# EAGLE design KIM1_Teletype_Board_rev1 (EAGLE 9.6.2)
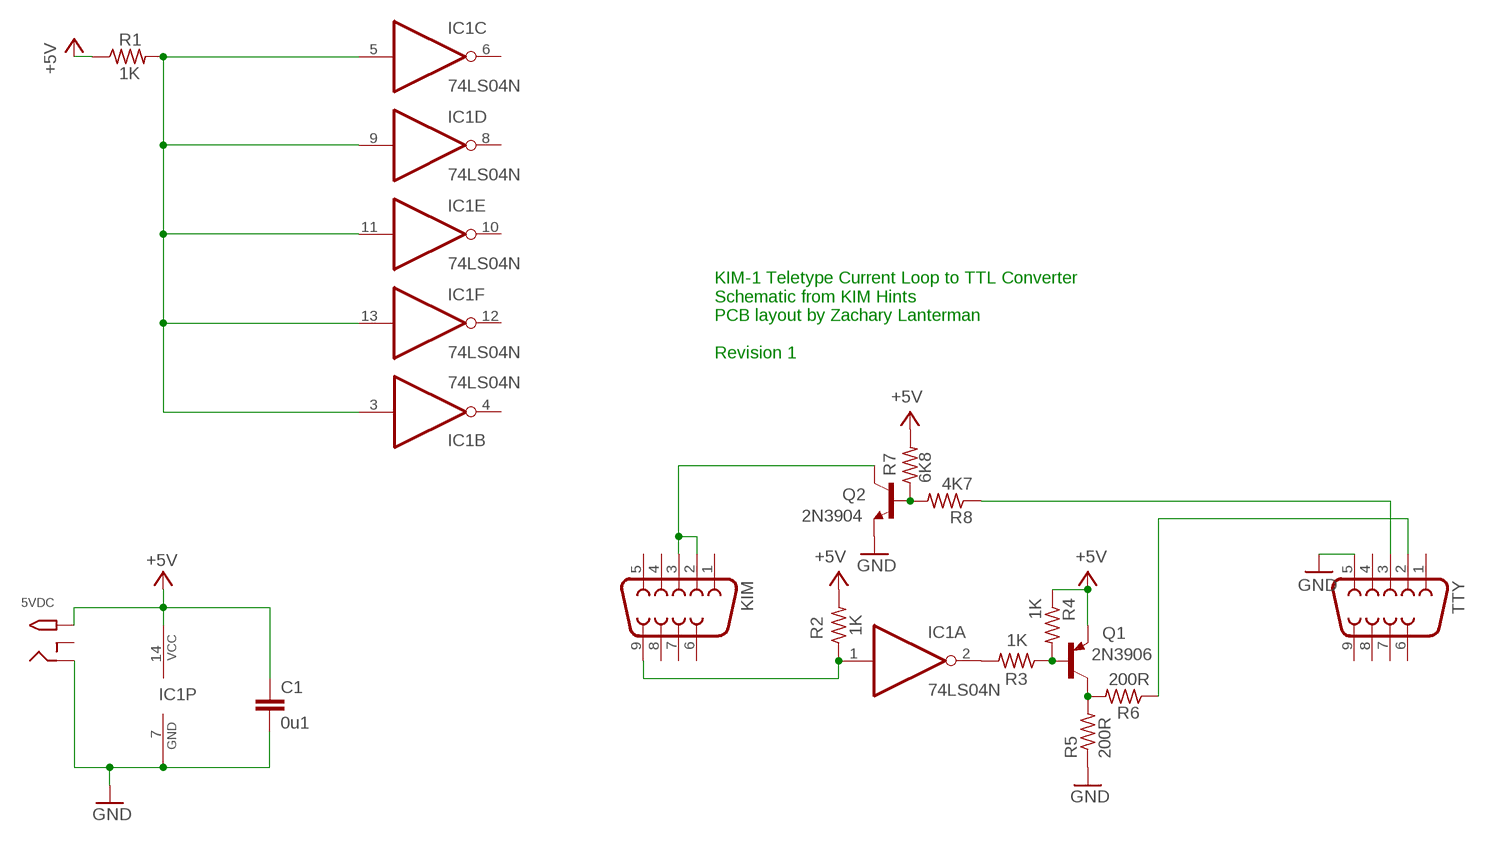
[diagram p0: schematic, sheet 1]

## Parts
5VDC  2.1MMJACKTHM  [PJ-102A]
C1  0u1  C-EU050-025X075-AARON  [C050-025X075-AARON]
IC1  74LS04N  [DIL14]
KIM  F09HP  [F09HP]
Q1  2N3906  [TO92]
Q2  2N3904  [TO92]
R1  1K  R-US_0207/10  [0207/10]
R2  1K  R-US_0207/10  [0207/10]
R3  1K  R-US_0207/10  [0207/10]
R4  1K  R-US_0207/10  [0207/10]
R5  200R  R-US_0207/10  [0207/10]
R6  200R  R-US_0207/10  [0207/10]
R7  6K8  R-US_0207/10  [0207/10]
R8  4K7  R-US_0207/10  [0207/10]
TTY  F09HP  [F09HP]

## Nets
+5V: 5VDC.TIP C1.1 IC1.14(P:VCC) Q1.3(E) R1.1 R2.2 R4.1 R7.2
GND: 5VDC.RING C1.2 IC1.7(P:GND) Q2.3(E) R5.1 TTY.5
N$1: IC1.2(A:O) R3.2
N$2: Q1.2(B) R3.1 R4.2
N$4: Q1.1(C) R5.2 R6.2
N$5: IC1.3(B:I) IC1.5(C:I) IC1.9(D:I) IC1.11(E:I) IC1.13(F:I) R1.2
N$6: R6.1 TTY.2
N$7: KIM.2 KIM.3 Q2.1(C)
N$8: Q2.2(B) R7.1 R8.2
N$9: R8.1 TTY.3
U: IC1.1(A:I) KIM.9 R2.1
Unconnected: 5VDC.RING_SW IC1.4(B:O) IC1.6(C:O) IC1.8(D:O) IC1.10(E:O) IC1.12(F:O) KIM.1 KIM.4 KIM.5 KIM.6 KIM.7 KIM.8 TTY.1 TTY.4 TTY.6 TTY.7 TTY.8 TTY.9

## Notes on the sheet
- KIM-1 Teletype Current Loop to TTL Converter
  Schematic from KIM Hints
  PCB layout by Zachary Lanterman
  
  Revision 1

## Library data of the parts
5VDC = adafruit:2.1MMJACK: 2.1mm x 5.5mm THM DC jack with internal switch. Digikey part #PJ-102A, 4UCON part #05537 2.1mm x 5.5mm SMT DC jack with internal switch. Digikey part #PJ-002A-SMT, 4UCON part #03267 By microbuilder.eu & adafruit.com
C1 = aaroncaps:C-EU: CAPACITOR, European symbol
IC1 = 74xx-us:74*04: Hex INVERTER
KIM TTY = con-subd:F09: SUB-D; OC_FARNELL: unknown; OC_NEWARK: unknown
Q1 = transistor-pnp:2N3906: PNP Transistor
Q2 = transistor:2N3904: NPN TRANSISTOR
R1-R8 = rcl:R-US_: RESISTOR, American symbol; SPICEPREFIX: R

## Board
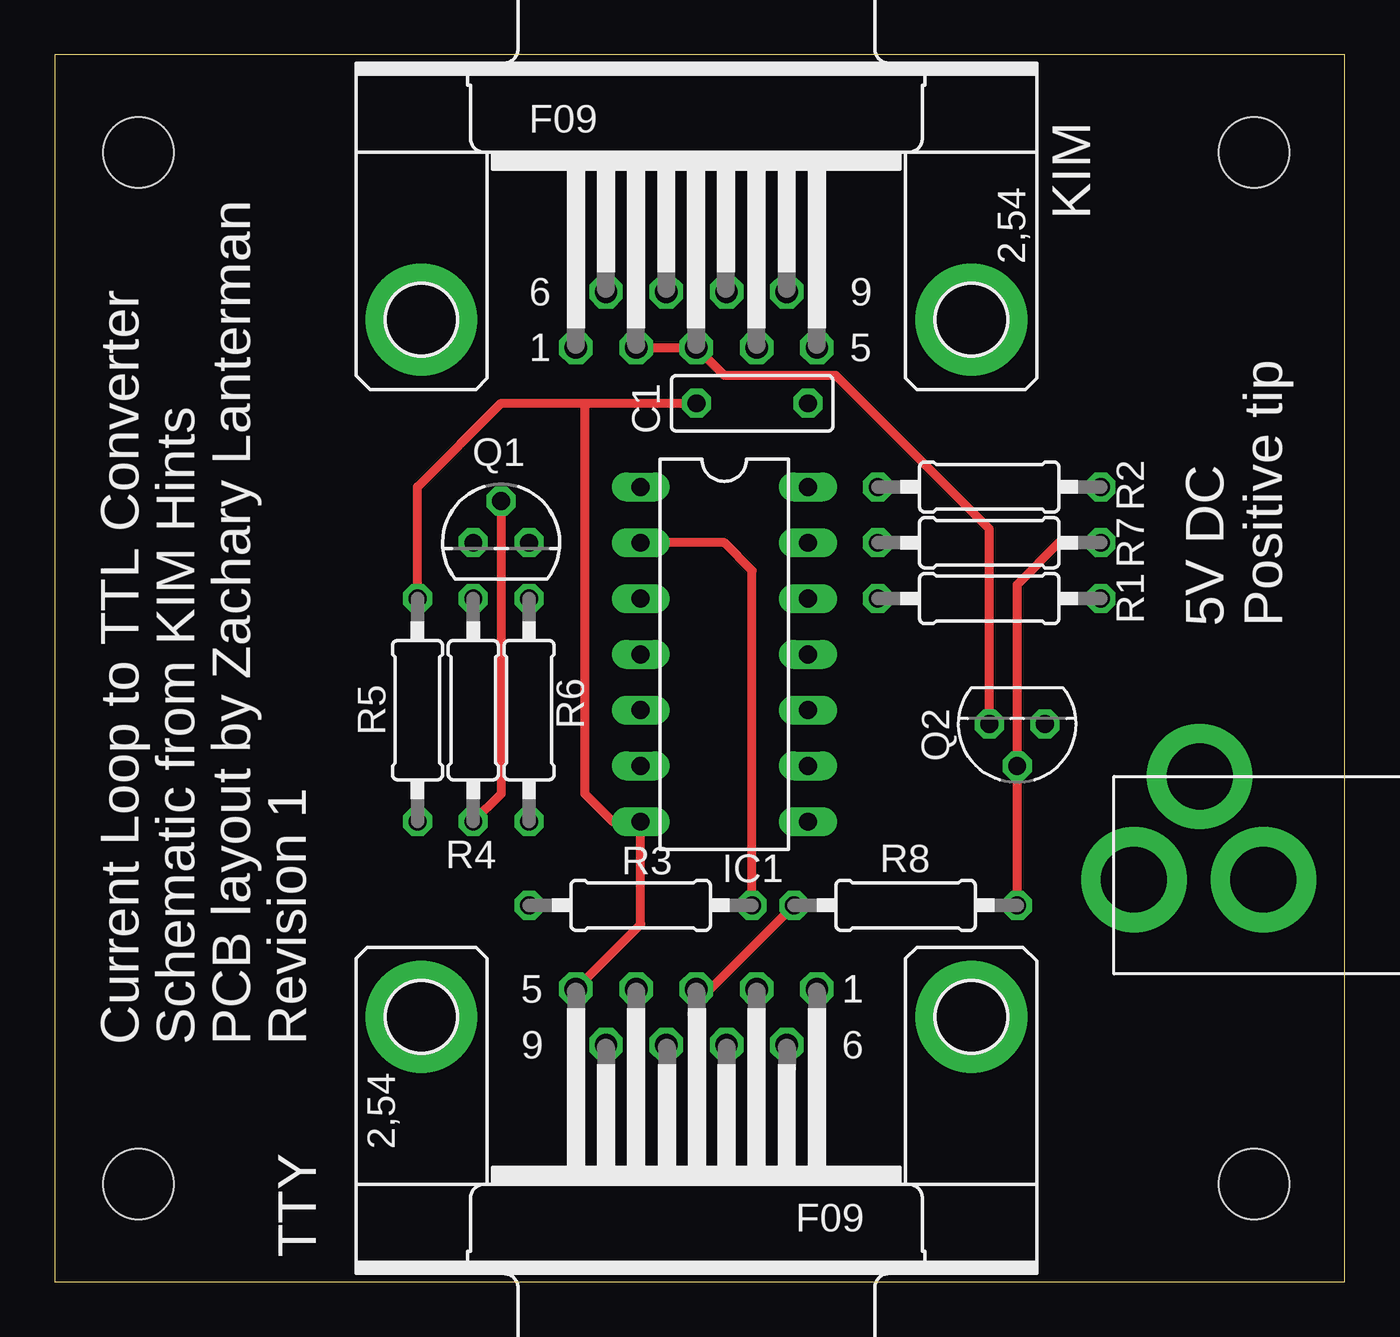
[diagram p1: board, top side]
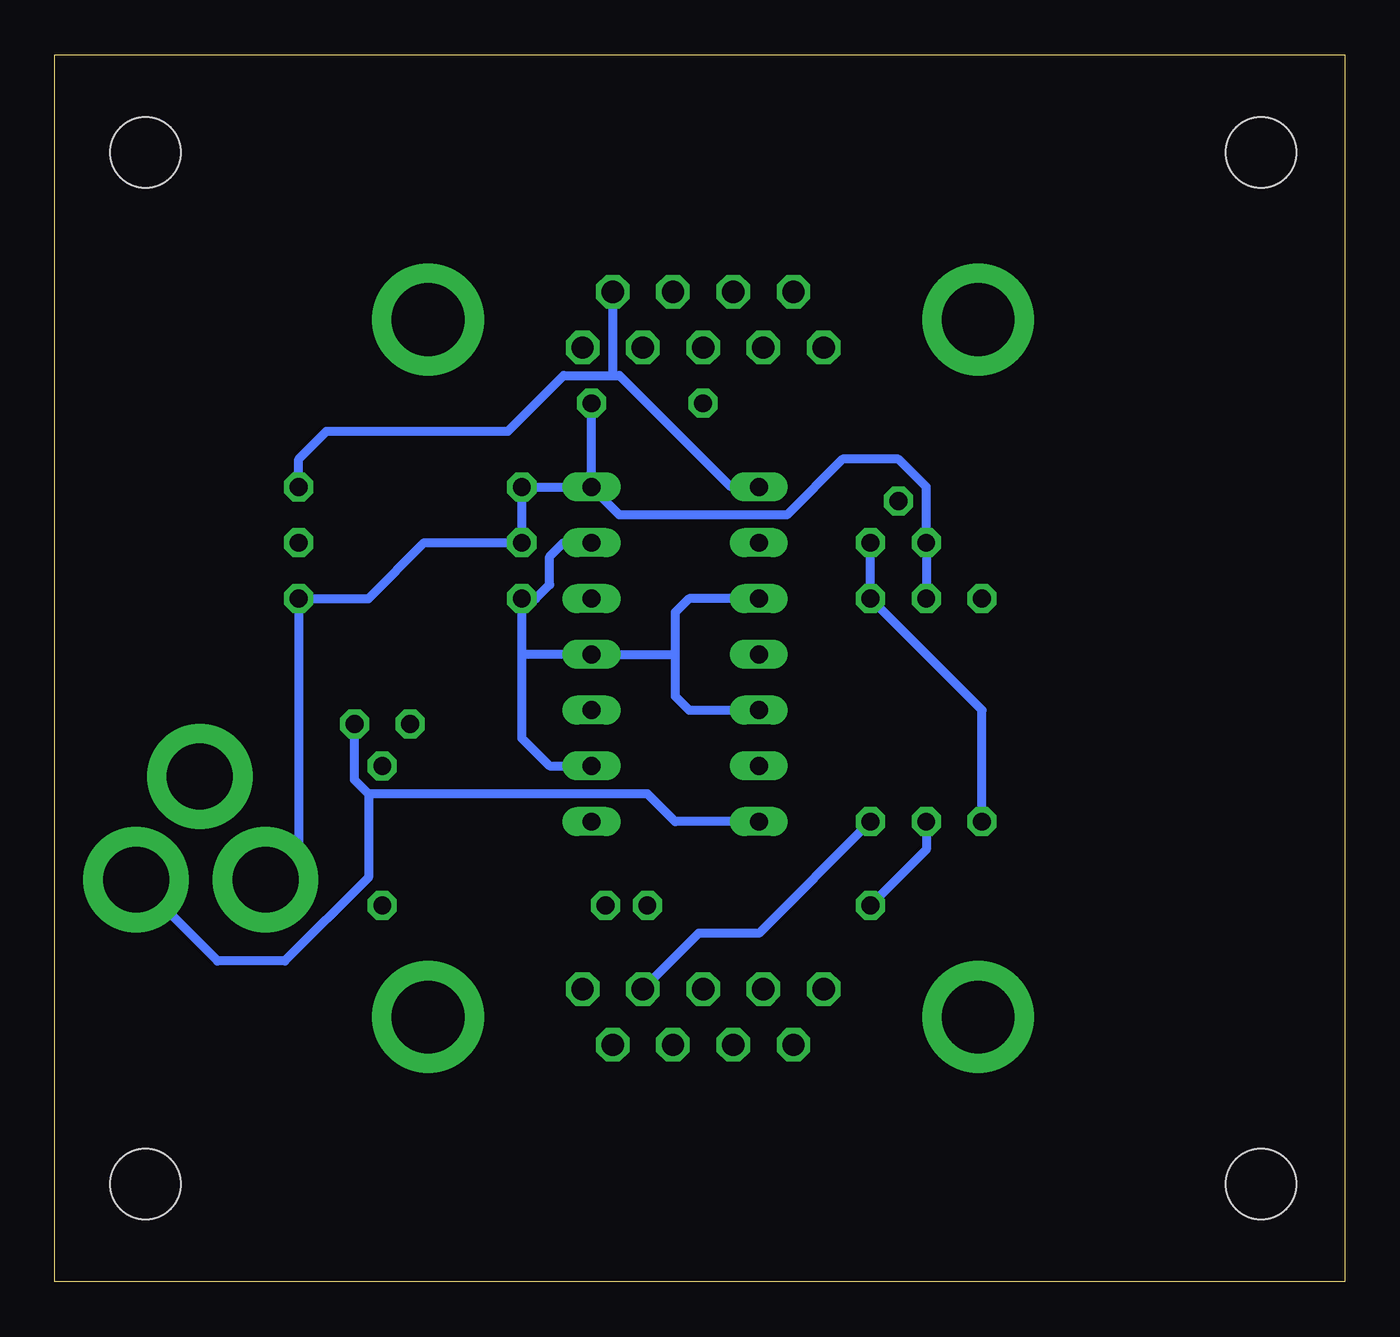
[diagram p2: board, bottom side, seen from below]

Size 58.72 x 55.87 mm. Coordinates in mm from the lower left corner, seen from the top.
Outline: 0,0 58.72,0 58.72,55.87 0,55.87 0,0
Copper layers (1*16): Top 0.035mm / dielectric 1.5mm / Bottom 0.035mm
Design rules "default": minimum track width 6mil, minimum drill 0.35mm, track to track 6mil, track to pad 6mil, pad to pad 6mil, via to via 6mil, smd to smd 6mil, copper to edge 40mil, drill to drill 6mil, minimum pad ring 10mil, minimum via ring 8mil, stop-mask expansion 4mil, vias tented up to drill 0mil, thermal gap 10mil
Holes 3.2 mm at 3.81,4.45 54.61,4.45 54.61,51.44 3.81,51.44

### Footprints (pad centres in the part's own frame; a part is rotated, then mirrored left to right if it is on the bottom)
PJ-102A = drill 3 pad 4.8: RING 0.1,-3.39; RING_SW -4.6,-6.29; TIP 0.1,-9.29
C050-025X075-AARON = drill 0.813 octagon: 1 -2.54,0; 2 2.54,0
DIL14 = drill 0.813 long: 1 -7.62,-3.81; 2 -5.08,-3.81; 3 -2.54,-3.81; 4 0,-3.81; 5 2.54,-3.81; 6 5.08,-3.81; 7 7.62,-3.81; 8 7.62,3.81; 9 5.08,3.81; 10 2.54,3.81; 11 0,3.81; 12 -2.54,3.81; 13 -5.08,3.81; 14 -7.62,3.81
F09HP = drill 1.016 octagon: 1 -5.486,-1.27; 2 -2.743,-1.27; 3 0,-1.27; 4 2.743,-1.27; 5 5.486,-1.27; 6 -4.115,1.27; 7 -1.372,1.27; 8 1.372,1.27; 9 4.115,1.27 | drill 3.302 pad 5.08: G1 -12.522,0; G2 12.522,0
TO92 = drill 0.813 octagon: 1 1.27,0; 2 0,1.905; 3 -1.27,0
0207/10 = drill 0.813 octagon: 1 -5.08,0; 2 5.08,0

### Placement (x,y rotation side)
5VDC  58.42,18.41 270 top
C1  31.75,40 180 top
IC1  30.48,28.58 270 top
KIM  29.21,43.81 0 top
Q1  20.32,33.66 0 top
Q2  43.81,25.4 180 top
R1  42.55,31.12 180 top
R2  42.55,36.2 180 top
R3  26.67,17.14 0 top
R4  19.05,26.03 270 top
R5  16.51,26.03 270 top
R6  21.59,26.03 90 top
R7  42.55,33.66 180 top
R8  38.73,17.14 0 top
TTY  29.21,12.06 180 top

### Tracks (layer width: path | path; a pad name or v marks a point on that pad's centre or on a via)
+5V
  Bottom 0.406: IC1.14 R2.2 R7.2 41.91,33.66 44.45,31.12 R1.1 47.62,19.82 5VDC.TIP | R4.1 Q1.3 19.05,36.2 20.32,37.46 22.86,37.46 25.4,34.92 33.02,34.92 IC1.14 | IC1.14 C1.1
GND
  Top 0.406: R5.1 16.51,36.2 20.32,40 24.13,40 | 24.13,40 C1.2 | 24.13,40 24.13,22.23 25.4,20.95 IC1.7 26.67,16.28 TTY.5
  Bottom 0.406: IC1.7 30.48,20.95 31.75,22.23 44.45,22.23 | 44.45,22.23 45.08,22.86 Q2.3 | 5VDC.RING 51.32,14.6 48.26,14.6 44.45,18.41 44.45,22.23
N$1
  Top 0.406: R3.2 31.75,32.38 30.48,33.66 IC1.2
N$2
  Top 0.406: Q1.2 20.32,22.23 R4.2
  Bottom 0.406: R4.2 19.05,19.69 R3.1
N$4
  Bottom 0.406: Q1.1 R6.2 16.51,26.03 R5.2
N$5
  Bottom 0.406: 37.47,28.58 37.47,24.77 36.2,23.49 IC1.9 | 37.47,28.58 IC1.11 30.48,28.58 | IC1.3 29.84,31.12 30.48,30.48 30.48,28.58 | 30.48,28.58 30.48,26.67 29.84,26.03 IC1.5 | 37.47,28.58 R1.2 36.83,31.12 36.2,31.75 36.2,33.02 35.56,33.66 IC1.13
N$6
  Bottom 0.406: R6.1 26.67,15.88 29.41,15.88 TTY.2
N$7
  Top 0.406: Q2.1 42.55,34.29 35.56,41.28 30.48,41.28 KIM.3 KIM.2
N$8
  Top 0.406: R7.1 45.72,33.66 43.81,31.75 Q2.2 R8.2
N$9
  Top 0.406: R8.1 29.84,13.34 TTY.3
U
  Bottom 0.406: R2.1 47.62,37.46 46.36,38.73 38.1,38.73 35.56,41.28 33.38,41.28 | 33.38,41.28 33.02,41.28 27.94,36.2 IC1.1 | KIM.9 33.33,41.33 33.38,41.28

### Text on the board
tNames: 5V DC / Positive tip | Current Loop to TTL Converter | Schematic from KIM Hints | PCB layout by Zachary Lanterman | Revision 1